# Altium schematic sheet P1.schdoc
size 297 x 210 mm; Device: Sheet-Symbol_A4; Symbol: Sheet-Symbol_A4; Company: 嘉立创EDA; Version: V1.0; Page Size: A4; @Project Name: stm32f4; @Page Count: 1; @Update Date: 2025-11-13; @Create Date: 2025-11-13; @Schematic Name: TP5400电源板-v1.1; @Page No: 1; @Page Name: P1; @Board Name: TP5400电源板-v1.1; @Create Time: 15:17:01; @Update Time: 23:17:01
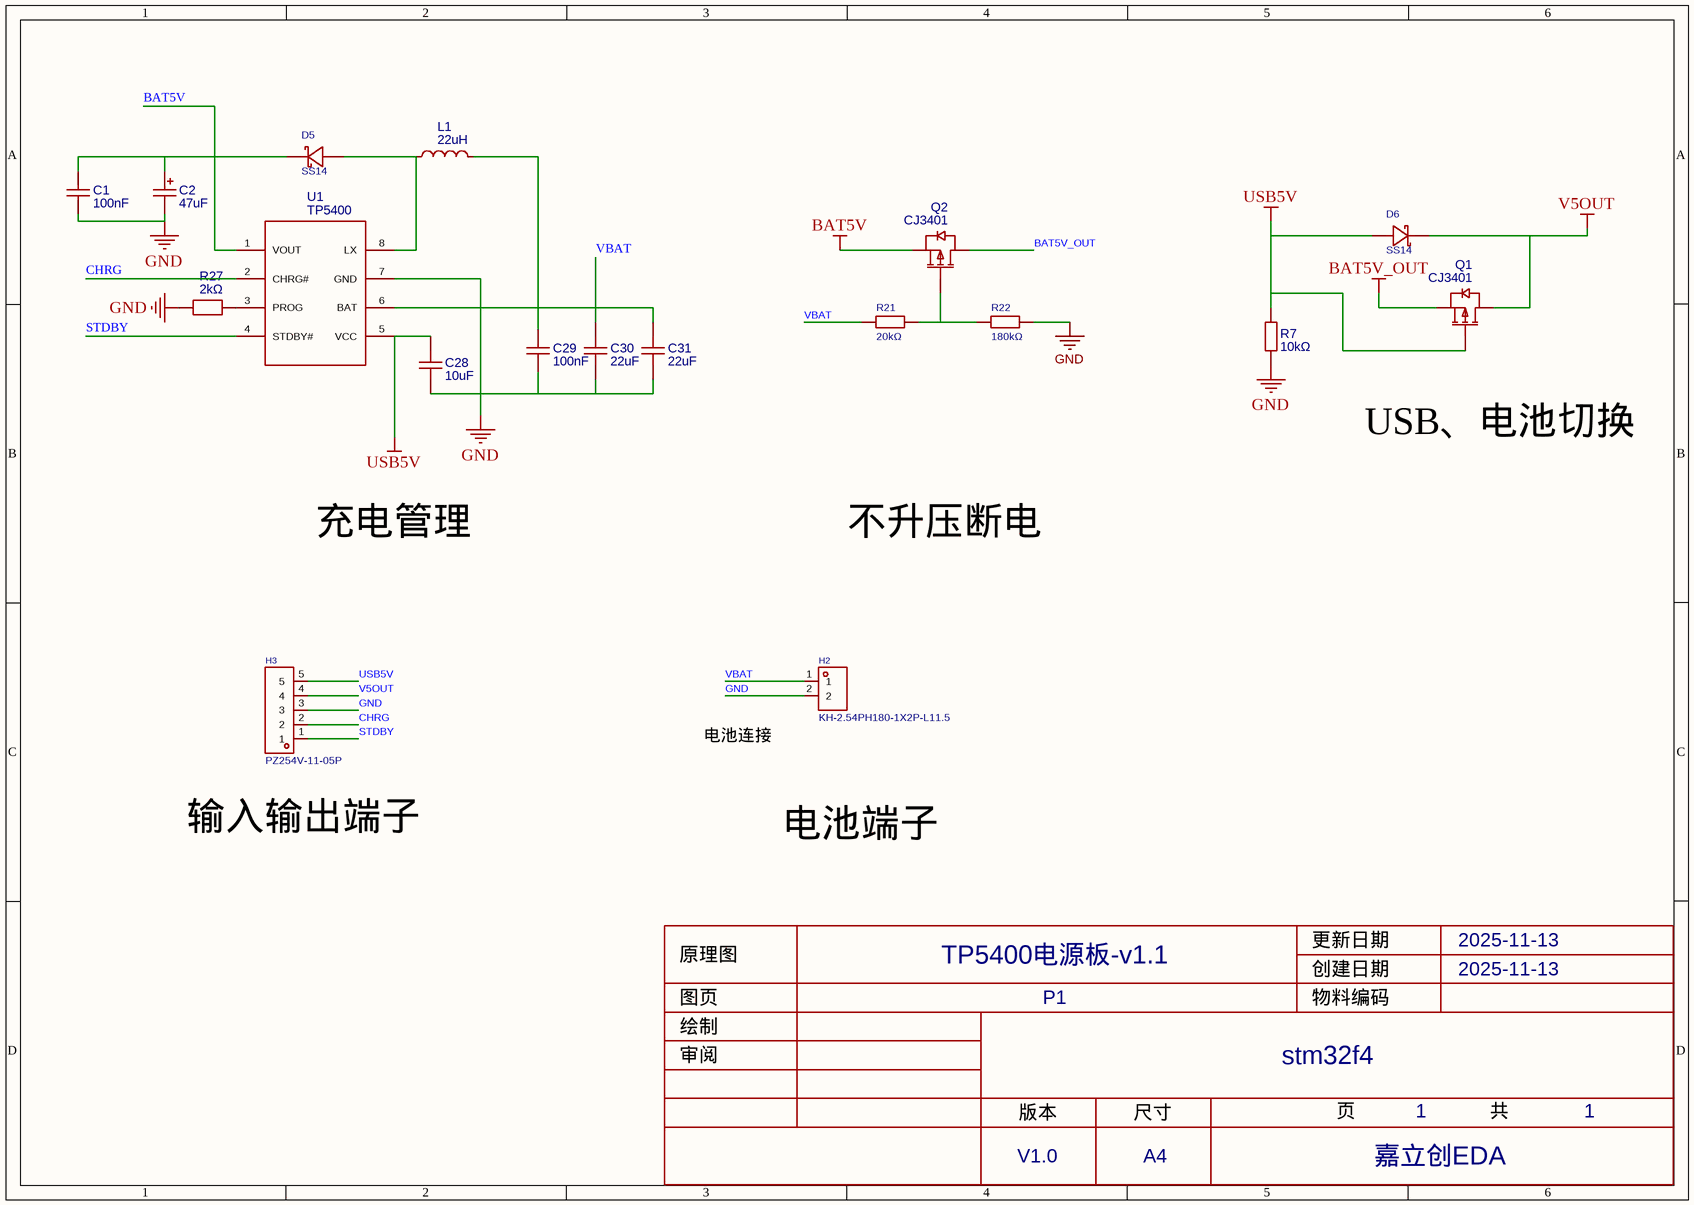
[diagram p0: P1.schdoc]

## Parts
C1  100nF  [C0805_1]
C2  47uF  [CASE-B_3528]
C28  10uF  [C0805_1]
C29  100nF  [C0805_1]
C30  22uF  [C0805_1]
C31  22uF  [C0805_1]
D5  SS14  [SOD-123FL_L2.8-W1.8-LS3.7-RD]
D6  SS14  [SOD-123FL_L2.8-W1.8-LS3.7-RD]
H2  KH-2.54PH180-1X2P-L11.5  [HDR-TH_2P-P2.54-V-M_1]
H3  PZ254V-11-05P  [HDR-TH_5P-P2.54-V-M_1]
L1  22uH  [IND-SMD_L4.5-W4.0_SCCD43]
Q1  CJ3401  [SOT-23-3_L2.9-W1.6-P1.90-LS2.8-BR_1]
Q2  CJ3401  [SOT-23-3_L2.9-W1.6-P1.90-LS2.8-BR_1]
R7  10kΩ  [R0805_1]
R21  20kΩ  [R0805_1]
R22  180kΩ  [R0805_1]
R27  2kΩ  [R0805_1]
U1  TP5400  [ESOP-8_L4.9-W3.9-P1.27-LS6.0-BL-EP]

## Nets
BAT5V: C1.2 C2.1 D5.1(A) Q2.2(S) U1.1(VOUT)
BAT5V_OUT: Q1.2(S) Q2.3(D)
GND: C1.1 C2.2 C28.2 C29.1 C30.1 C31.1 H2.2 H3.3 R7.1 R22.2 R27.1 U1.7(GND)
USB5V: C28.1 D6.2(K) H3.5 Q1.1(G) R7.2 U1.5(VCC)
V5OUT: D6.1(A) H3.4 Q1.3(D)
CHRG: H3.2 U1.2(CHRG#)
STDBY: H3.1 U1.4(STDBY#)
VBAT: C29.2 C30.2 C31.2 H2.1 L1.2 R21.1 U1.6(BAT)
NetD5_2: D5.2(K) L1.1 U1.8(LX)
NetQ2_1: Q2.1(G) R21.2 R22.1
NetR27_2: R27.2 U1.3(PROG)

## Notes on the sheet
- USB、电池切换
- 充电管理
- 不升压断电
- 电池连接
- 输入输出端子
- 电池端子
- 更新日期
- 2025-11-13
- 原理图
- 图页
- TP5400电源板-v1.1
- P1
- 创建日期
- 物料编码
- 审阅
- 绘制
- stm32f4
- 版本
- V1.0
- 尺寸
- A4
- 页
- 1
- 嘉立创EDA
- 共

## Library data of the parts
C1 C29 = CL21B104KBCNNNC: Manufacturer: SAMSUNG(三星); Origin Footprint: C0805; Convert to PCB: yes; Tolerance: ±10%; Voltage Rated: 50V; Temperature Coefficient: X7R; ModelId: 1ba041120af144c991958decab20d241; ModelName: C0805_L2.0-W1.3-H1.3; ModelTransform: 78.74,51.181,0,0,0,0,0,0.0005,0; Device: CL21B104KBCNNNC; Symbol: 100nF; Add into BOM: yes; FootprintName: C0805_1; LCSC Part Name: 100nF ±10% 50V; SupplierPart: C1711; ManufacturerPart: CL21B104KBCNNNC; Supplier Footprint: 0805; JLCPCB Part Class: Extended Part; Datasheet: https://atta.szlcsc.com/upload/public/pdf/source/20160103/1457707693305.pdf; Supplier: LCSC; Value: 100nF
C2 = CA45-B-10V-47uF-K: Manufacturer: CEC(振华新云); Origin Footprint: CAP-SMD_L3.5-W2.8-R-RD; Convert to PCB: yes; Tolerance: ±10%; Rated Voltage: 10V; Equivalent Series Resistance(ESR): 2.4Ω@100kHz; ModelId: b77bd53aeda446d2bdd09b0fdaf9418a; ModelName: CASE-B_L3.5-W2.8-H1.9; ModelTransform: 145.669,110.236,0,0,0,0,0,0,0; Device: CA45-B-10V-47uF-K; Symbol: 47uF; Add into BOM: yes; FootprintName: CASE-B_3528; LCSC Part Name: 47uF ±10% 10V; SupplierPart: C136658; ManufacturerPart: CA45-B-10V-47uF-K; Supplier Footprint: CASE-B-3528; JLCPCB Part Class: Extended Part; Datasheet: https://atta.szlcsc.com/upload/public/pdf/source/20171123/C136658_15114108124621137439.pdf; Supplier: LCSC; Value: 47uF; Operating Temperature: -55℃~+125℃
C28 = 0805F106M160NT: Manufacturer: FH(风华); Origin Footprint: C0805; Convert to PCB: yes; Tolerance: ±20%; Voltage Rated: 16V; Temperature Coefficient: Y5V; ModelId: 1ba041120af144c991958decab20d241; ModelName: C0805_L2.0-W1.3-H1.3; ModelTransform: 78.74,51.181,0,0,0,0,0,0.0005,0; Device: 0805F106M160NT; Symbol: 10uF; Add into BOM: yes; FootprintName: C0805_1; LCSC Part Name: 10uF ±20% 16V; SupplierPart: C90545; ManufacturerPart: 0805F106M160NT; Supplier Footprint: 0805; JLCPCB Part Class: Extended Part; Datasheet: https://atta.szlcsc.com/upload/public/pdf/source/20170923/C90545_1506149563743988971.pdf; Supplier: LCSC; Value: 10uF
C30 C31 = CL21A226MAQNNNE_C45783: Manufacturer: SAMSUNG(三星); Origin Footprint: C0805; Convert to PCB: yes; Tolerance: ±20%; Voltage Rated: 25V; Temperature Coefficient: X5R; ModelId: 1ba041120af144c991958decab20d241; ModelName: C0805_L2.0-W1.3-H1.3; ModelTransform: 78.74,51.181,0,0,0,0,0,0.0005,0; Device: CL21A226MAQNNNE_C45783; Symbol: 22uF; Add into BOM: yes; FootprintName: C0805_1; LCSC Part Name: 22uF ±20% 25V; SupplierPart: C45783; ManufacturerPart: CL21A226MAQNNNE; Supplier Footprint: 0805; JLCPCB Part Class: Basic Part; Datasheet: https://atta.szlcsc.com/upload/public/pdf/source/20160103/1457707727161.pdf; Supplier: LCSC; Value: 22uF
D5 D6 = SS14_C2909920: Manufacturer: KUU; AddInBom: yes; Reverse Voltage (Vr): 40V; Average Rectified Current (Io): 1A; Forward Voltage (Vf@If): 550mV@1A; Reverse Leakage Current (Ir): 500uA@40V; ModelId: b8c4b3388b3d4c198b22b876116f592b; ModelTransform: 145.669,70.866,0,0,0,0,0,0,0; Device: SS14_C2909920; Symbol: SS14_C2909920; FootprintName: SOD-123FL_L2.8-W1.8-LS3.7-RD; LCSC Part Name: 40V 1A 550mV@1A; SupplierPart: C2909920; ManufacturerPart: SS14; Supplier Footprint: SOD-123FL; JLCPCB Part Class: Extended Part; Datasheet: https://atta.szlcsc.com/upload/public/pdf/source/20211028/6407406DF6AAB99A3E103CB6CA1E22D5.pdf; Supplier: LCSC; ConvertToPcb: yes; Diode Configuration: -; ModelName: SOD-123FL_L2.8-W1.8-LS3.7-RD
H2 = KH-2.54PH180-1X2P-L11.5: Manufacturer: kinghelm(金航标); AddInBom: yes; Pitch: 2.54mm; Pin Structure: 1x2P; Circluar Pins/Square Pins: 方针; Current Rating (Max): 3A; ModelId: e35305ec3aa84b66b849f914b715e73f; ModelName: HDR2.54-M-LI-1X2P; ModelTransform: 200,100,0,0,0,0,0,0,-118.11; Device: KH-2.54PH180-1X2P-L11.5; Symbol: KH-2.54PH180-1X2P-L11.5; Supplier: LCSC; Supplier Part: C2905434; Manufacturer Part: KH-2.54PH180-1X2P-L11.5; JLCPCB Part Class: 扩展库; FootprintName: HDR-TH_2P-P2.54-V-M_1; LCSC Part Name: 2.54mm 1x2P 直插 方针; Supplier Footprint: 直插,P=2.54mm; ConvertToPcb: yes; Number of Rows: 单排; Number of Pins: 2; Row Spacing: -; Mounting Type: 直插; Voltage Rating (Max): -; Length of Mating Pin: 6mm; Insulation Height: 2.5mm; Length of End Connection Pin: 3mm; Contact Material: -; Operating Temperature Range: -40℃~+105℃; Color: 黑色
H3 = PZ254V-11-05P_1: Manufacturer: XFCN(兴飞); AddInBom: yes; Pitch: 2.54mm; Pin Structure: 1x5P; Circluar Pins/Square Pins: 方针; ModelId: 47d466e4a34f4fc5bc626cf773a24dd5; ModelName: HDR-TH_5P-P2.54-M-LI-1X5P; ModelTransform: 499.999,100,0,0,0,0,0,0,-118.11; Device: PZ254V-11-05P_1; Symbol: PZ254V-11-05P_1; Supplier: LCSC; Supplier Part: C492404; Manufacturer Part: PZ254V-11-05P; JLCPCB Part Class: Extended Part; FootprintName: HDR-TH_5P-P2.54-V-M_1; LCSC Part Name: 2.54mm 1x5P 直插 方针; Supplier Footprint: 插件,P=2.54mm; Datasheet: https://atta.szlcsc.com/upload/public/pdf/source/20200309/C492404_E51533260F8710EFF5D4617281164C1D.pdf; ConvertToPcb: yes; Number of Rows: 单排; Number of Pins: 5P; Row Spacing: -; Mounting Type: 直插; Current Rating (Max): -; Voltage Rating (Max): -; Length of Mating Pin: 6mm; Insulation Height: 2.5mm; Length of End Connection Pin: 3mm; Contact Material: 黄铜; Contact Plating: -; Operating Temperature Range: -40℃~+105℃; Color: 黑色
L1 = SCCD43-220KT: Manufacturer: Yanchuang(研创); Convert to PCB: yes; ModelId: 979f186bb2ed46c794684c7f6ad4b7fcuser; ModelName: SPR_IND-SMD_L4.5-W4.0_(XRCD43_H3.2-W4.0_L4.5); ModelTransform: 157.48,170.22,126.38,0,0,0,0,0,0; Device: SCCD43-220KT; Symbol: 22uH; Origin Footprint: IND-SMD_L4.5-W4.0_SCCD43; Add into BOM: yes; FootprintName: IND-SMD_L4.5-W4.0_SCCD43; Supplier: LCSC; SupplierPart: C532863; ManufacturerPart: SCCD43-220KT; JLCPCB Part Class: Extended Part
Q1 = CJ3401: Manufacturer: CJ(江苏长电/长晶); Origin Footprint: SOT-23-3_L2.9-W1.6-P1.90-LS2.8-BR; Convert to PCB: yes; Type: P沟道; Drain Source Voltage (Vdss): 30V; Continuous Drain Current (Id): 4.2A; Power Dissipation (Pd): 350mW; Drain Source On Resistance (RDS(on)@Vgs,Id): 65mΩ@10V,4.2A; Gate Threshold Voltage (Vgs(th)@Id): 1.3V@250uA; ModelId: 89cb27a44ab2466697082bb9fd73a7d0; ModelName: SOT-23-3L_L2.9-W1.6-H1.1-LS2.8-P0.95; ModelTransform: 110.236,114.173,0,180,0,0,-0.005,0.0005,0; Device: CJ3401; Symbol: CJ3401; Add into BOM: yes; FootprintName: SOT-23-3_L2.9-W1.6-P1.90-LS2.8-BR_1; LCSC Part Name: P沟道 30V 4.2A; SupplierPart: C13799; ManufacturerPart: CJ3401; Supplier Footprint: SOT-23; JLCPCB Part Class: Extended Part; Datasheet: https://atta.szlcsc.com/upload/public/pdf/source/20140815/1457707217656.pdf; Supplier: LCSC
Q2 = CJ3401: Manufacturer: CJ; Origin Footprint: SOT-23-3_L2.9-W1.6-P1.90-LS2.8-BR; Convert to PCB: yes; Device: CJ3401; Symbol: CJ3401; Add into BOM: yes; FootprintName: SOT-23-3_L2.9-W1.6-P1.90-LS2.8-BR_1; Supplier: LCSC; ManufacturerPart: CJ3401; SupplierPart: C13799; JLCPCB Part Class: Extended Part
R7 = AC0805FR-0710KL: Manufacturer: YAGEO(国巨); Symbol: 10K; Origin Footprint: R0805; Convert to PCB: yes; Tolerance: ±1%; Power(Watts): 125mW; Temperature Coefficient: ±100ppm/℃; Overload Voltage (Max): 150V; ModelId: 37a81e68749a4138bd2dfa6897b24b85; ModelName: R0805_L2.0-W1.3-H0.6; ModelTransform: 78.74,51.181,0,0,0,0,0,-0.0005,0; Device: AC0805FR-0710KL; Resistance: 10kΩ; Add into BOM: yes; FootprintName: R0805_1; LCSC Part Name: 10kΩ ±1% 125mW; SupplierPart: C140868; ManufacturerPart: AC0805FR-0710KL; Supplier Footprint: 0805; JLCPCB Part Class: Extended Part; Datasheet: https://atta.szlcsc.com/upload/public/pdf/source/20171113/C140868_15105613027091115785.pdf; Supplier: LCSC; Type: 厚膜电阻; Value: 10kΩ; Operating Temperature Range: -55℃~+155℃
R21 = 0805W8F2002T5E: Manufacturer: UNI-ROYAL(厚声); AddInBom: yes; Tolerance: ±1%; Power(Watts): 125mW; Temperature Coefficient: ±100ppm/℃; Overload Voltage (Max): 150V; ModelId: 37a81e68749a4138bd2dfa6897b24b85; ModelName: R0805_L2.0-W1.3-H0.6; ModelTransform: 78.74,51.181,0,0,0,0,0,-0.0005,0; Device: 0805W8F2002T5E; Symbol: 0805W8F2002T5E; FootprintName: R0805_1; LCSC Part Name: 20kΩ ±1% 125mW; SupplierPart: C4328; ManufacturerPart: 0805W8F2002T5E; Supplier Footprint: 0805; JLCPCB Part Class: Basic Part; Datasheet: https://atta.szlcsc.com/upload/public/pdf/source/20200306/C422600_1E6D84923E4A46A82E41ADD87F860B5C.pdf; Supplier: LCSC; ConvertToPcb: yes; Type: 厚膜电阻; Value: 20kΩ; Operating Temperature Range: -55℃~+155℃
R22 = 0805W8F1803T5E: Manufacturer: UNI-ROYAL(厚声); AddInBom: yes; Tolerance: ±1%; Power(Watts): 125mW; Temperature Coefficient: ±100ppm/℃; Overload Voltage (Max): 150V; ModelId: 37a81e68749a4138bd2dfa6897b24b85; ModelName: R0805_L2.0-W1.3-H0.6; ModelTransform: 78.74,51.181,0,0,0,0,0,-0.0005,0; Device: 0805W8F1803T5E; Symbol: 0805W8F1803T5E; FootprintName: R0805_1; LCSC Part Name: 180kΩ ±1% 125mW; SupplierPart: C17501; ManufacturerPart: 0805W8F1803T5E; Supplier Footprint: 0805; JLCPCB Part Class: Basic Part; Datasheet: https://atta.szlcsc.com/upload/public/pdf/source/20200306/C422600_1E6D84923E4A46A82E41ADD87F860B5C.pdf; Supplier: LCSC; ConvertToPcb: yes; Type: 厚膜电阻; Value: 180kΩ; Operating Temperature Range: -55℃~+155℃
R27 = MR08X2001FTL: Manufacturer: Walsin(华新科); Resistance: 2K; Origin Footprint: R0805; Convert to PCB: yes; Tolerance: ±1%; Power(Watts): 250mW; Temperature Coefficient: ±100ppm/℃; Overload Voltage (Max): 150V; ModelId: 37a81e68749a4138bd2dfa6897b24b85; ModelName: R0805_L2.0-W1.3-H0.6; ModelTransform: 78.74,51.181,0,0,0,0,0,-0.0005,0; Device: MR08X2001FTL; Symbol: 2kΩ; Add into BOM: yes; FootprintName: R0805_1; LCSC Part Name: 厚膜电阻 2kΩ ±1% 250mW; SupplierPart: C431841; ManufacturerPart: MR08X2001FTL; Supplier Footprint: 0805; JLCPCB Part Class: Extended Part; Datasheet: https://atta.szlcsc.com/upload/public/pdf/source/20190927/C431928_EFD0274D1DCD4BC1E8C9515D468AAF68.pdf; Supplier: LCSC; Type: 厚膜电阻; Value: 2kΩ; Operating Temperature Range: -55℃~+155℃
U1 = TP5400: 锂电池充电，升压二合一芯片，南京拓品微电子有限公司生产; Manufacturer: TOPPOWER(南京拓微); Origin Footprint: SOIC-8_L5.0-W4.0-P1.27-LS6.0-BL-EP; Convert to PCB: yes; ModelId: d3e00daa36c445139c055a3b9efb85d2; ModelName: ESOP-8_L4.9-W3.9-H1.6-LS6.0-P1.27; ModelTransform: 240.157,192.913,0,90,0,0,0,0,0; Device: TP5400; Symbol: TP5400; JLCPCB Part Class: Extended Part; image: //image.lceda.cn/szlcsc/C24154.jpg; Add into BOM: yes; FootprintName: ESOP-8_L4.9-W3.9-P1.27-LS6.0-BL-EP; LCSC Part Name: TP5400; SupplierPart: C2891434; ManufacturerPart: TP5400; Supplier Footprint: ESOP-8; Datasheet: https://atta.szlcsc.com/upload/public/pdf/source/20210909/352D9D40D77A1DD73F7904E364EF004B.pdf; Supplier: LCSC